# Altium schematic sheet push-button-switch-11.SchDoc
size A4; SheetNumber: 11; SheetTotal: 17
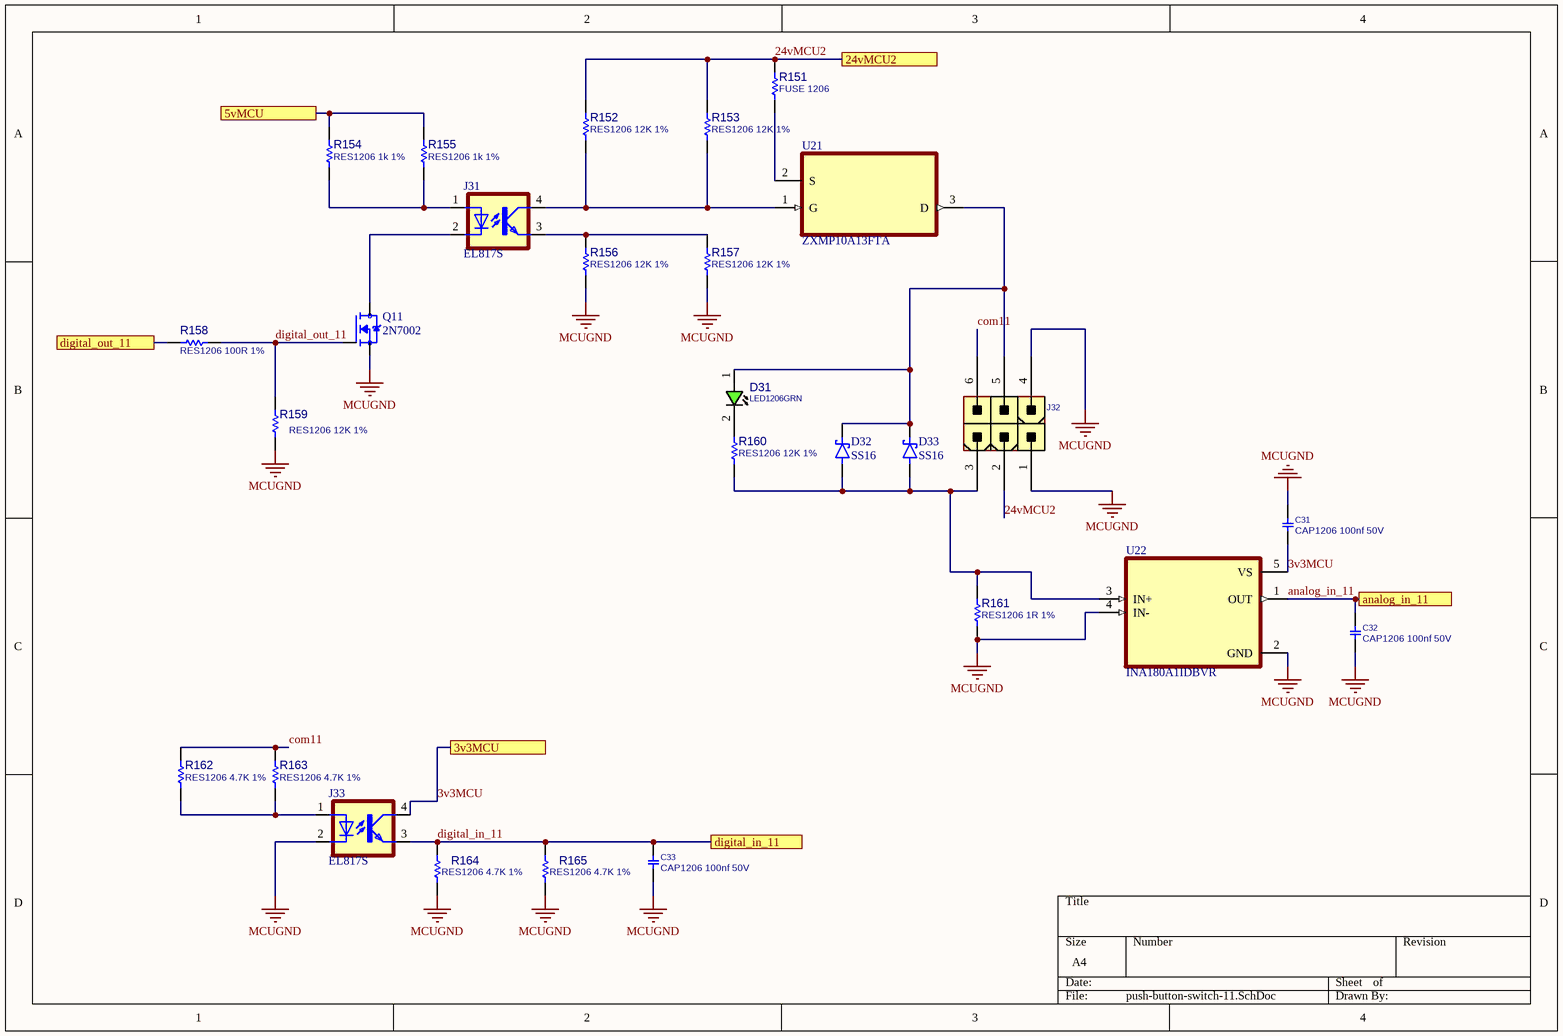
[diagram p0: push-button-switch-11.SchDoc]

## Parts
C31  CAP1206 100nf 50V  [C1206]
C32  CAP1206 100nf 50V  [C1206]
C33  CAP1206 100nf 50V  [C1206]
D31  LED1206GRN  [LED1206GRN]
D32  SS16  [DIOM4325X250N]
D33  SS16  [DIOM4325X250N]
J31  EL817S  [SOIC254P1030X460-4N]
J32  CONN_ATXPWR_6  [ATXPWR_6]  (value not drawn)
J33  EL817S  [SOIC254P1030X460-4N]
Q11  2N7002  [SOT95P240X111-3N]
R151  FUSE 1206  [R1206]
R152  RES1206 12K 1%  [R1206]
R153  RES1206 12K 1%  [R1206]
R154  RES1206 1k 1%  [R1206]
R155  RES1206 1k 1%  [R1206]
R156  RES1206 12K 1%  [R1206]
R157  RES1206 12K 1%  [R1206]
R158  RES1206 100R 1%  [R1206]
R159  RES1206 12K 1%  [R1206]
R160  RES1206 12K 1%  [R1206]
R161  RES1206 1R 1%  [R1206]
R162  RES1206 4.7K 1%  [R1206]
R163  RES1206 4.7K 1%  [R1206]
R164  RES1206 4.7K 1%  [R1206]
R165  RES1206 4.7K 1%  [R1206]
U21  ZXMP10A13FTA  [SOT95P230X110-3N]
U22  INA180A1IDBVR  [SOT95P280X145-5N]

## Ports
3v3MCU, 5vMCU, 24vMCU2, analog_in_11, digital_in_11, digital_out_11

## Nets
MCUGND: C31.1 C32.2 C33.2 J32.1 J32.4 J33.2(C) Q11.2(S) R156.2 R157.2 R159.2 R161.2 R164.1 R165.1 U22.2(GND) U22.4(IN-)
3v3MCU: C31.2 J33.4(COL) U22.5(VS) ; port 3v3MCU
5vMCU: R154.2 R155.2 ; port 5vMCU
24vMCU2: J32.2 R151.1 R152.1 R153.1 ; port 24vMCU2
analog_in_11: C32.1 U22.1(OUT) ; port analog_in_11
com11: J32.6 R162.2 R163.2
digital_in_11: C33.1 J33.3(EMIT) R164.2 R165.2 ; port digital_in_11
digital_out_11: Q11.1(G) R158.2 R159.1
digital_out_11: R158.1 ; port digital_out_11  [a separate net that carries the same name]
NetD31_1: D31.1(ANODE) D32.C(K) D33.C(K) J32.5 U21.3(D)
NetD31_2: D31.2(CATHODE) R160.1
NetD32_A: D32.A D33.A J32.3 R160.2 R161.1 U22.3(IN+)
NetJ31_1: J31.1(A) R154.1 R155.1
NetJ31_2: J31.2(C) Q11.3(D)
NetJ31_3: J31.3(EMIT) R156.1 R157.1
NetJ31_4: J31.4(COL) R152.2 R153.2 U21.1(G)
NetJ33_1: J33.1(A) R162.1 R163.1
NetR151_2: R151.2 U21.2(S)

## Library data of the parts
C31-C33 = CAP_SMD_MLCC_1206: CAP, MLCC; PARAM: -, -%; MANF_P#: MANF_PART#; PARAM2: -V; PRICE: 100= 1$; MANF: -; ASSEMBLY: ASSEMBLY
D31 = LED_SMD_1206_GRN: LED, SMD, 1206, GREEN; PARAM: 20mA; DESC: DESCRIPTION; PARAM2: 2.2V; MANF: -; ASSEMBLY: ASSEMBLY; PRICE: 36t@Javan; MANF_P#: -; VALUE: LED1206GRN; MountType: SMT; PartType: LED
D32 D33 = SS14: 1A, 40V, Schottky Rectifier; MF: Taiwan Semiconductor; SnapEDA_Link: https://www.snapeda.com/parts/SS14/taiwan/view-part/?ref=snap; Package: SMA-2 Taiwan Semiconductor; Value: *; MP: SS14; Check_prices: https://www.snapeda.com/parts/SS14/taiwan/view-part/?ref=eda
J31 J33 = EL817S: Optoisolator Transistor Output 5000Vrms 1 Channel 4-SMD; MF: Everlight Electronics; SnapEDA_Link: https://www.snapeda.com/parts/EL817S/Everlight+Electronics+Co+Ltd/view-part/?ref=snap; Package: SMD-4 Everlight Electronics Co Ltd; Value: *; MP: EL817S; Check_prices: https://www.snapeda.com/parts/EL817S/Everlight+Electronics+Co+Ltd/view-part/?ref=eda
J32 = CONN_ATXPWR_6: CONN, ATX POWER, 6 P; MANF: TE; MANF_P#: 4-1775099-1; VALUE: CONN_ATXPWR_6; MountType: THD; PACKAGE: ATXPWR-6pin; Part Type: Conn.
Q11 = 2N7002: N-Channel 60V 280mA (Ta) 350mW (Ta) Surface Mount SOT-23-3 (TO-236); MF: {'manufacturer': u'onsemi'}; Package: None; Price: None; Value: *; MP: 2N7002; Availability: Unavailable
R151-R165 = RES_SMD_1206: RESISTOR, SMD; PARAM: 1%, 0.25W; DESC: DESCRIPTION; DIST#: MOUSER; MANF_P#: -; MANF: -; ASSEMBLY: ASSEMBLY; PRICE: -; PARAM2: -
U21 = ZXMP10A13FTA: P-Channel 100 V 600mA (Ta) 625mW (Ta) Surface Mount SOT-23-3; MF: Diodes Inc.; Purchase-URL: https://pricing.snapeda.com/search/part/ZXMP10A13FTA/?ref=eda; Package: SOT-23-3 Diodes Inc.; SnapEDA_Link: https://www.snapeda.com/parts/ZXMP10A13FTA/Diodes+Inc./view-part/?ref=snap; Availability: In Stock; Value: *; MP: ZXMP10A13FTA; Check_prices: https://www.snapeda.com/parts/ZXMP10A13FTA/Diodes+Inc./view-part/?ref=eda; Price: None
U22 = INA180A1IDBVR: 26V, 350kHz current sense amplifier; MF: Texas Instruments; SnapEDA_Link: https://www.snapeda.com/parts/INA180A1IDBVR/Texas+Instruments/view-part/?ref=snap; Package: SOT-23-5 Texas Instruments; Value: *; MP: INA180A1IDBVR; Check_prices: https://www.snapeda.com/parts/INA180A1IDBVR/Texas+Instruments/view-part/?ref=eda